# Altium project FPGA_ENTRY.PrjPcb
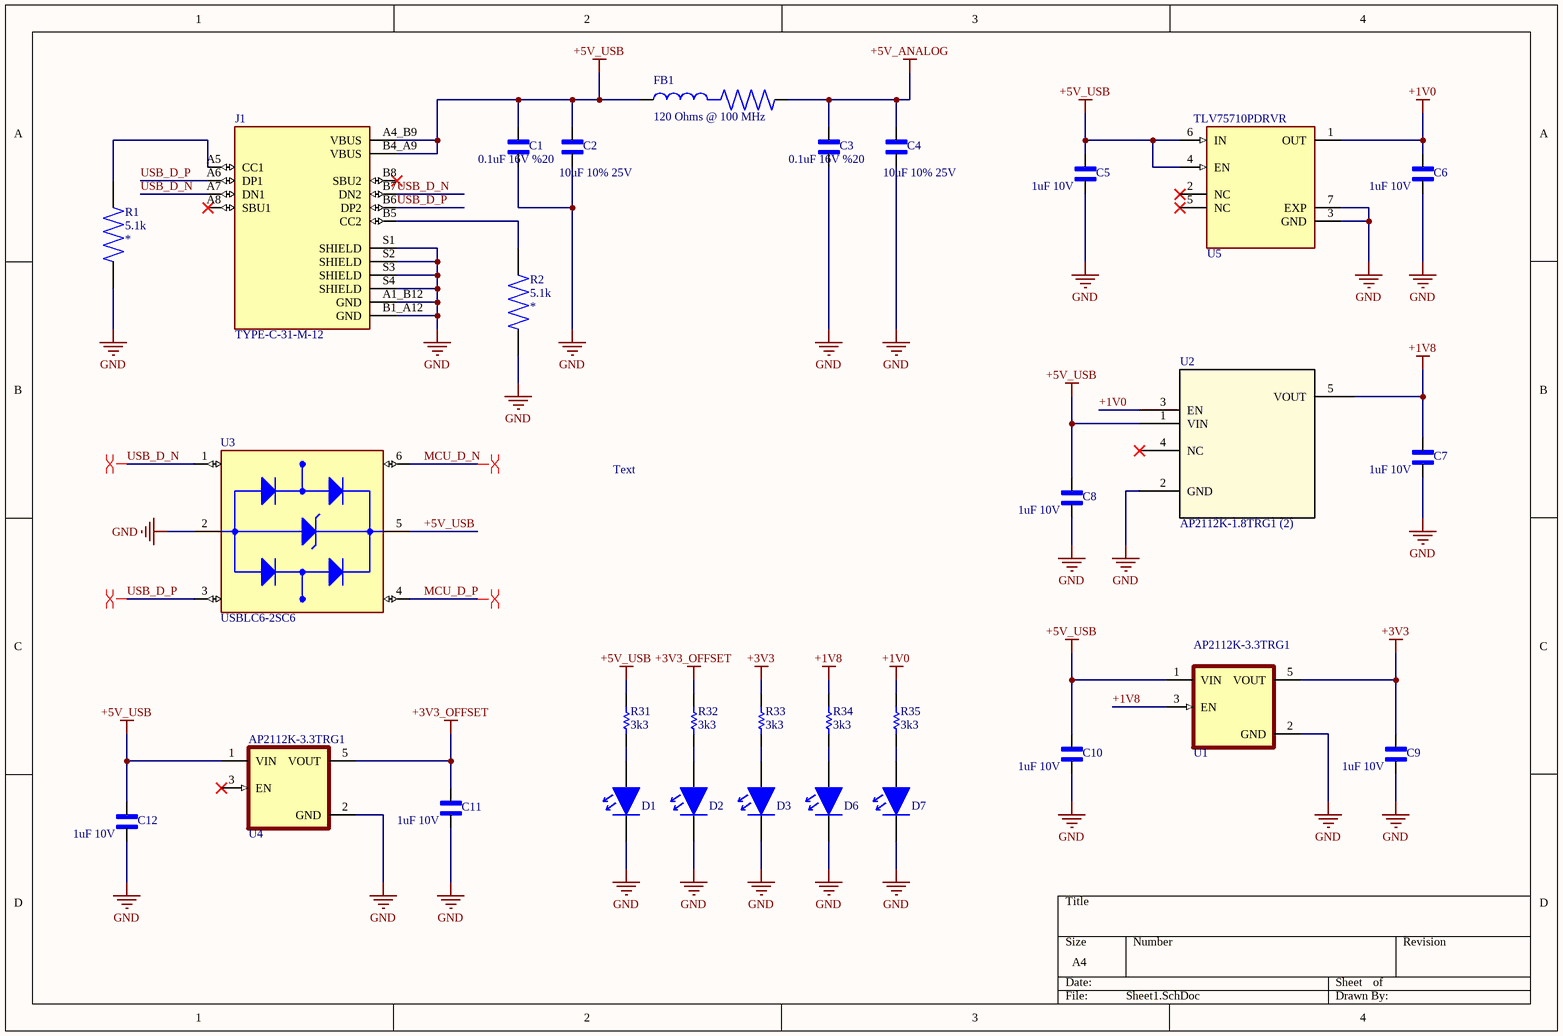
[diagram p0: Sheet1.SchDoc]
6 sheets, 134 parts. Net scope: global (net labels, ports and power ports of the same name join across sheets).
Board file: PCB1.PcbDoc
Sheets:
  Sheet1.SchDoc
  Sheet2.SchDoc
  Sheet3.SchDoc
  Sheet4.SchDoc
  Sheet5.SchDoc
  Sheet6.SchDoc

## Sheet Sheet1.SchDoc
size A4; SheetNumber: 1; SheetTotal: 6

### Parts
C1  Parameter 1: 0.1uF 16V %20  [0402]  (hidden comment: 0402YC104MAT2A)
C2  Parameter 1: 10uF 10% 25V  [0603]  (hidden comment: GRM21BZ71E106KE15L)
C3  Parameter 1: 0.1uF 16V %20  [0402]  (hidden comment: 0402YC104MAT2A)
C4  Parameter 1: 10uF 10% 25V  [0603]  (hidden comment: GRM21BZ71E106KE15L)
C5  Parameter 1: 1uF 10V  [0603]  (hidden comment: CAP_CER_0603)
C6  Parameter 1: 1uF 10V  [0603]  (hidden comment: CAP_CER_0603)
C7  Parameter 1: 1uF 10V  [0603]  (hidden comment: CAP_CER_0603)
C8  Parameter 1: 1uF 10V  [0603]  (hidden comment: CAP_CER_0603)
C9  Parameter 1: 1uF 10V  [0603]  (hidden comment: CAP_CER_0603)
C10  Parameter 1: 1uF 10V  [0603]  (hidden comment: CAP_CER_0603)
C11  Parameter 1: 1uF 10V  [0603]  (hidden comment: CAP_CER_0603)
C12  Parameter 1: 1uF 10V  [0603]  (hidden comment: CAP_CER_0603)
D1  LTST-C171GKT  [LED_GREEN_0805]  (value not drawn)
D2  LTST-C171GKT  [LED_GREEN_0805]  (value not drawn)
D3  LTST-C171GKT  [LED_GREEN_0805]  (value not drawn)
D6  LTST-C171GKT  [LED_GREEN_0805]  (value not drawn)
D7  LTST-C171GKT  [LED_GREEN_0805]  (value not drawn)
FB1  Parameter 1: 120 Ohms @ 100 MHz  [0603_FB]  (hidden comment: BLM18PG121SN1D)
J1  TYPE-C-31-M-12  [HRO_TYPE-C-31-M-12]
R1  5.1k  [0603]
R2  5.1k  [0603]
R31  3k3  [RESC1005X40X20NL05T10]
R32  3k3  [RESC1005X40X20NL05T10]
R33  3k3  [RESC1005X40X20NL05T10]
R34  3k3  [RESC1005X40X20NL05T10]
R35  3k3  [RESC1005X40X20NL05T10]
U1  AP2112K-3.3TRG1  [SOT-25]
U2  AP2112K-1.8TRG1 (2)  [AP2112K-1.8TRG1_DIO]
U3  USBLC6-2SC6  [SOT95P280X145-6N]
U4  AP2112K-3.3TRG1  [SOT-25]
U5  TLV75710PDRVR  [WSON-6]

### Nets
+1V0: C6.2 R35.2 U2.3(EN) U5.1(OUT)
+1V8: C7.2 R34.2 U1.3(EN) U2.5(VOUT)
+3V3: C9.2 R33.2 U1.5(VOUT)
+3V3_OFFSET: C11.2 R32.2 U4.5(VOUT)
+5V_ANALOG: C3.2 C4.2 FB1.2
+5V_USB: C1.2 C2.2 C5.2 C8.2 C10.2 C12.2 FB1.1 J1.A4_B9(VBUS) J1.B4_A9(VBUS) R31.2 U1.1(VIN) U2.1(VIN) U3.5(VBUS) U4.1(VIN) U5.4(EN) U5.6(IN)
GND: C1.1 C2.1 C3.1 C4.1 C5.1 C6.1 C7.1 C8.1 C9.1 C10.1 C11.1 C12.1 D1.1 D2.1 D3.1 D6.1 D7.1 J1.A1_B12(GND) J1.B1_A12(GND) J1.S1(SHIELD) J1.S2(SHIELD) J1.S3(SHIELD) J1.S4(SHIELD) R1.1 R2.1 U1.2(GND) U2.2(GND) U3.2(GND) U4.2(GND) U5.3(GND) U5.7(EXP)
MCU_D_N: U3.6(I/O1_OUT)
MCU_D_P: U3.4(I/O2_OUT)
USB_D_N: J1.A7(DN1) J1.B7(DN2) U3.1(I/O1_IN)
USB_D_P: J1.A6(DP1) J1.B6(DP2) U3.3(I/O2_IN)
NetD1_2: D1.2 R31.1
NetD2_2: D2.2 R32.1
NetD3_2: D3.2 R33.1
NetD6_2: D6.2 R34.1
NetD7_2: D7.2 R35.1
NetJ1_A5: J1.A5(CC1) R1.2
NetJ1_B5: J1.B5(CC2) R2.2

Not connected (* = marked no-connect by the designer): J1 A8(SBU1)* B8(SBU2)*; U2 4(NC)*; U4 3(EN)*; U5 2(NC)* 5(NC)*

### Layout directives
differential pair: MCU_D_N, MCU_D_P, USB_D_N, USB_D_P

### Notes on the sheet
- Text

### Library data of the parts
C1 C3 = CAP_CER_0402: 0.1 µF ±20% 16V Ceramic Capacitor X7R 0402 (1005 Metric)
C2 C4 = GRM21BZ71E106KE15L: SMD capacitor X7R(MURATA) with capacitance 10uF Tol.10%. Rated voltage 25Vdc 125C
C5-C12 = CAP_CER_0603: CAP CER 1UF 10V X7R 0603 / AC0603KRX7R6BB105
D1-D3 D6 D7 = LED GREEN 0805: Green 0805 130 º Min 5 mcd Typical 12 mcd Water Clear Lens SMT LED; Manufacturer: Vishay Lite-On; Designed by: BERK; Lens Color: Colorless; Viewing Angle: 130°; Lens Style: Diffused,Colorless,Rectangular,Clear; Luminous Intensity: 12mcd; Forward Current: 30mA; Forward Voltage: 2.1V; Power Rating: 100mW; Dominant Wavelength: 569nm; Test Current: 10mA; Number of Elements: 1; Wavelength: 585nm; Reverse Voltage: 5V; Supplier 1: Digi-Key; Manufacturer Part Number: LTST-C171GKT; RoHS: Yes; Category: LEDs; Stock 1: 159023; Pricing 1: 1=0,26000, 10=0,14100, 100=0,06560, 500=0,06060, 1000=0,04747 (USD); Mount: Surface Mount; Case/Package: 0805; Number of Pins: 2; Color: Green; Case Code (Metric): 2012; Case Code (Imperial): 0805; Min Operating Temperature: -55°C; Max Operating Temperature: 85°C; Package Quantity: 1; Packaging: Tape and Reel; Illumination Color: Green; Lens Transparency: Clear; Power Dissipation: 100mW; Number of LEDs: 1; Series: CHIPLED 0805; Length: 2mm; Width: 1.25mm; Height: 0.8mm; Depth: 1.25mm; Radiation Hardening: No; Lead Free: Lead Free; RoHS Compliant: Yes; ComponentLink1URL: https://datasheet.ciiva.com/2110/ltst-c171gkt-2110000.pdf?src-supplier=Digi-Key; ComponentLink1Description: https://datasheet.ciiva.com/2110/ltst-c171gkt-2110000.pdf?src-supplier=Digi-Key; ComponentLink2URL: https://datasheet.ciiva.com/11773/0900766b80dc0296-11773991.pdf?src-supplier=RSComponents; ComponentLink2Description: https://datasheet.ciiva.com/11773/0900766b80dc0296-11773991.pdf?src-supplier=RSComponents; ComponentLink3URL: https://datasheet.ciiva.com/12400/lite-on-ltst-c171gkt-190133-12400647.pdf?src-supplier=Mouser; ComponentLink3Description: https://datasheet.ciiva.com/12400/lite-on-ltst-c171gkt-190133-12400647.pdf?src-supplier=Mouser; ComponentLink4URL: https://datasheet.ciiva.com/2110/ltst-c171gkt-2110001.pdf?src-supplier=Digi-Key; ComponentLink4Description: https://datasheet.ciiva.com/2110/ltst-c171gkt-2110001.pdf?src-supplier=Digi-Key; ComponentLink5URL: https://datasheet.ciiva.com/2110/ltst-c171gkt-2110002.pdf?src-supplier=Digi-Key; ComponentLink5Description: https://datasheet.ciiva.com/2110/ltst-c171gkt-2110002.pdf?src-supplier=Digi-Key; ComponentLink6URL: https://datasheet.ciiva.com/16396/ltst-c171gkt-16396549.pdf?src-supplier=Future+Electronics; ComponentLink6Description: https://datasheet.ciiva.com/16396/ltst-c171gkt-16396549.pdf?src-supplier=Future+Electronics; Supplier Part Number 1: 160-1423-1-ND
FB1 = BLM18PG121SN1D: 120 Ohms @ 100 MHz 1 Power Line Ferrite Bead 0603 (1608 Metric) 2A 50mOhm
J1 = TYPE-C-31-M-12: USB Connectors 24 Receptacle 1 8.94*7.3mm RoHS; MF: HRO Electronics Co., Ltd.; SnapEDA_Link: https://www.snapeda.com/parts/TYPE-C-31-M-12/HRO+Electronics+Co.%252C+Ltd./view-part/?ref=snap; Package: Package; Value: *; MP: TYPE-C-31-M-12; Check_prices: https://www.snapeda.com/parts/TYPE-C-31-M-12/HRO+Electronics+Co.%252C+Ltd./view-part/?ref=eda
R1 R2 = RES_0603: Parameter 1: *
R31-R35 = CMP-2002-01682-1: Manufacturer: Vishay BCcomponents; Part Number: TNPW040210K0DEED
U1 U4 = AP2112K-3.3TRG1: Linear Voltage Regulator IC Positive Fixed 1 Output 600mA SOT-25
U2 = AP2112K-1.8TRG1 (2): AP2112 Series 1.8 V 600 mA Fixed Output SMT Voltage Regulator - SOT-23-5; Manufacturer: Diodes Inc.; Accuracy: 1.5%; Dropout Voltage: 500mV; Max Supply Voltage: 6V; Max Junction Temperature (Tj): 85°C; Max Output current: 600mA; Min Input Voltage: 2.5V; Number of Channels: 1; Output Voltage: 1.8V; Polarity: Positive; Quiescent Current: 80µA; Supplier: Arrow Electronics; Supplier Part Number: AP2112K-1.8TRG1; Manufacturer Part Number: AP2112K-1.8TRG1; RoHS: Compliant; Category: LDO Voltage Regulators; Stock: 5067; Pricing: 1=0,0897, 10=0,0624, 25=0,0577 (USD); Case/Package: LSSOP; China RoHS: Compliant; Export Control Classification Number (ECCN) Code: EAR99; Height: 1.3mm; Height - Seated (Max): 1.45mm; Harmonized Tariff Schedule (HTS) Code: 8542.39.00.60; Length: 2.92mm; Lifecycle Status: Production; Max Operating Temperature: 85°C; Min Operating Temperature: -40°C; Mounting Technology: Surface Mount; Number of Circuits: 1; Number of Outputs: 1; Pins: 5; Number of Regulators: 1; Number of Terminals: 5; Output Current: 600mA; Output Type: Fixed; Packaging: Tape & Reel (TR); REACH SVHC: Yes; Schedule B: 8542390000, 8542390000|8542390000, 8542390000|8542390000|8542390000, 8542390000|8542390000|8542390000|8542390000; Terminal Pitch: 950µm; Voltage Tolerance: 1.5%; Width: 1.6mm; ComponentLink1URL: https://datasheet.octopart.com:443/AP2112K-1.8TRG1-Diodes-Inc.-datasheet-101745658.pdf?src-supplier=IHS; ComponentLink1Description: https://datasheet.octopart.com:443/AP2112K-1.8TRG1-Diodes-Inc.-datasheet-101745658.pdf?src-supplier=IHS; ComponentLink2URL: https://datasheet.octopart.com:443/AP2112K-1.8TRG1-Diodes-Inc.-datasheet-182385097.pdf?src-supplier=IHS; ComponentLink2Description: https://datasheet.octopart.com:443/AP2112K-1.8TRG1-Diodes-Inc.-datasheet-182385097.pdf?src-supplier=IHS; ComponentLink3URL: https://datasheet.octopart.com:443/AP2112K-1.8TRG1-Diodes-Inc.-datasheet-37177583.pdf?src-supplier=SHENGYU+ELECTRONICS; ComponentLink3Description: https://datasheet.octopart.com:443/AP2112K-1.8TRG1-Diodes-Inc.-datasheet-37177583.pdf?src-supplier=SHENGYU+ELECTRONICS
U3 = USBLC6-2SC6: 17V Clamp 5A (8/20Âµs) Ipp Tvs Diode Surface Mount SOT-23-6; MF: STMicroelectronics; Value: *; SnapEDA_Link: https://www.snapeda.com/parts/USBLC6-2SC6/STMicroelectronics/view-part/?ref=snap; Check_prices: https://www.snapeda.com/parts/USBLC6-2SC6/STMicroelectronics/view-part/?ref=eda; Purchase-URL: https://pricing.snapeda.com/search/part/USBLC6-2SC6/?ref=eda; Price: None; Availability: In Stock; Package: SOT-23-6 STMicroelectronics; MP: USBLC6-2SC6
U5 = TLV75710PDRVR: 1-A, low-IQ high-accuracy low-dropout (LDO) voltage regulator with enable

## Sheet Sheet2.SchDoc
size A3; SheetNumber: 2; SheetTotal: 6
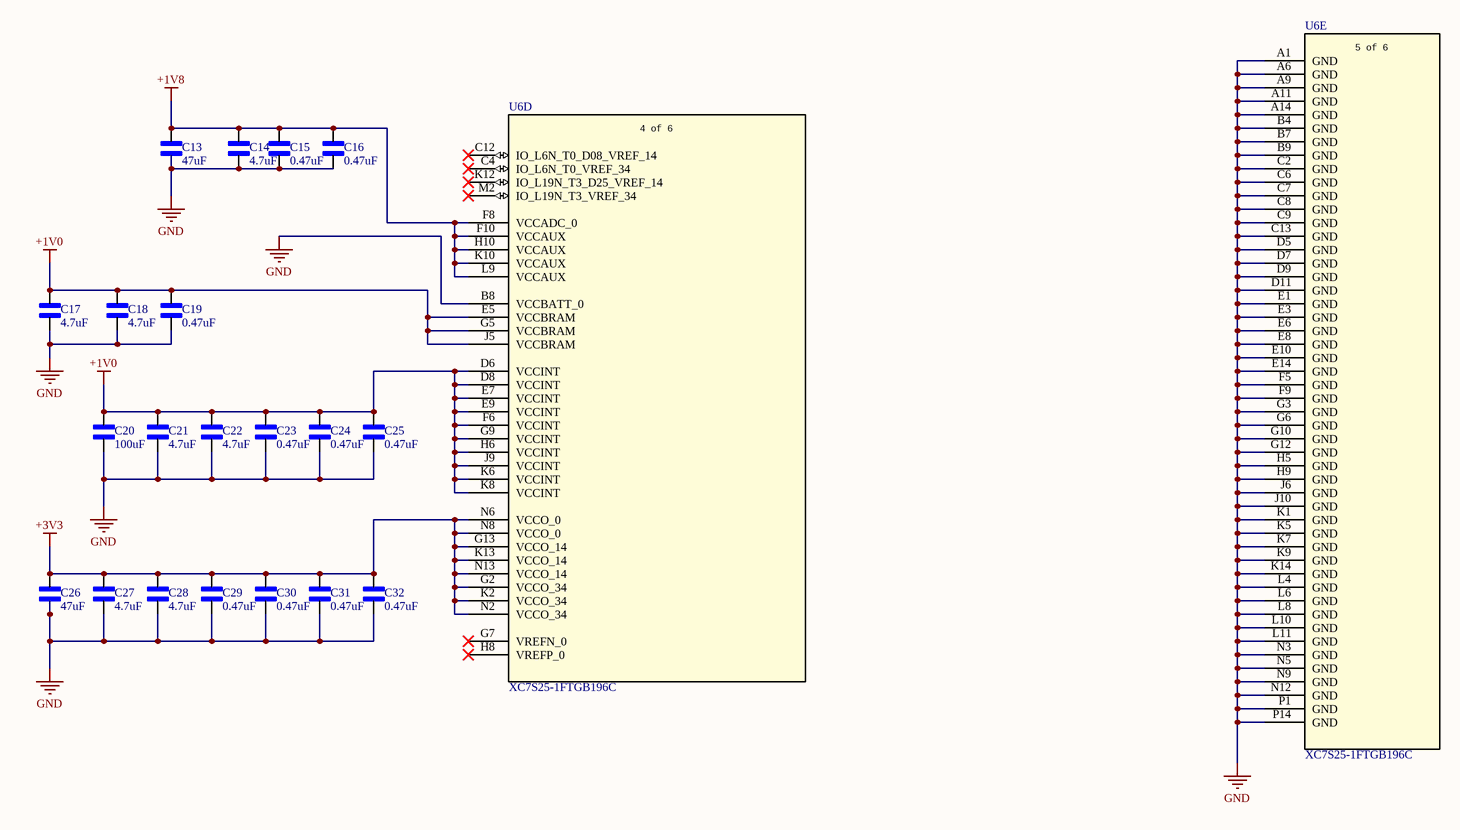
[diagram p1: Sheet2.SchDoc]

### Parts
C13  47uF  [GRM32ER70J476ME20L]
C14  4.7uF  [GRM21BR71A475KA73K]
C15  0.47uF  [GRM188R70J474KA01D]
C16  0.47uF  [GRM188R70J474KA01D]
C17  4.7uF  [GRM21BR71A475KA73K]
C18  4.7uF  [GRM21BR71A475KA73K]
C19  0.47uF  [GRM188R70J474KA01D]
C20  100uF  [GRM32ER60J107ME20L]
C21  4.7uF  [GRM21BR71A475KA73K]
C22  4.7uF  [GRM21BR71A475KA73K]
C23  0.47uF  [GRM188R70J474KA01D]
C24  0.47uF  [GRM188R70J474KA01D]
C25  0.47uF  [GRM188R70J474KA01D]
C26  47uF  [GRM32ER70J476ME20L]
C27  4.7uF  [GRM21BR71A475KA73K]
C28  4.7uF  [GRM21BR71A475KA73K]
C29  0.47uF  [GRM188R70J474KA01D]
C30  0.47uF  [GRM188R70J474KA01D]
C31  0.47uF  [GRM188R70J474KA01D]
C32  0.47uF  [GRM188R70J474KA01D]
U6  XC7S25-1FTGB196C  [FTGB196SPARTAN-7_AMD]  (parts D,E of 6)

### Nets
+1V0: C17.2 C18.2 C19.2 C20.2 C21.2 C22.2 C23.2 C24.2 C25.2 U6.D6(VCCINT) U6.D8(VCCINT) U6.E5(VCCBRAM) U6.E7(VCCINT) U6.E9(VCCINT) U6.F6(VCCINT) U6.G5(VCCBRAM) U6.G9(VCCINT) U6.H6(VCCINT) U6.J5(VCCBRAM) U6.J9(VCCINT) U6.K6(VCCINT) U6.K8(VCCINT)
+1V8: C13.2 C14.2 C15.2 C16.2 U6.F8(VCCADC_0) U6.F10(VCCAUX) U6.H10(VCCAUX) U6.K10(VCCAUX) U6.L9(VCCAUX)
+3V3: C26.2 C27.2 C28.2 C29.2 C30.2 C31.2 C32.2 U6.G2(VCCO_34) U6.G13(VCCO_14) U6.K2(VCCO_34) U6.K13(VCCO_14) U6.N2(VCCO_34) U6.N6(VCCO_0) U6.N8(VCCO_0) U6.N13(VCCO_14)
GND: C13.1 C14.1 C15.1 C16.1 C17.1 C18.1 C19.1 C20.1 C21.1 C22.1 C23.1 C24.1 C25.1 C26.1 C27.1 C28.1 C29.1 C30.1 C31.1 C32.1 U6.A1(GND) U6.A6(GND) U6.A9(GND) U6.A11(GND) U6.A14(GND) U6.B4(GND) U6.B7(GND) U6.B8(VCCBATT_0) U6.B9(GND) U6.C2(GND) U6.C6(GND) U6.C7(GND) U6.C8(GND) U6.C9(GND) U6.C13(GND) U6.D5(GND) U6.D7(GND) U6.D9(GND) U6.D11(GND) U6.E1(GND) U6.E3(GND) U6.E6(GND) U6.E8(GND) U6.E10(GND) U6.E14(GND) U6.F5(GND) U6.F9(GND) U6.G3(GND) U6.G6(GND) U6.G10(GND) U6.G12(GND) U6.H5(GND) U6.H9(GND) U6.J6(GND) U6.J10(GND) U6.K1(GND) U6.K5(GND) U6.K7(GND) U6.K9(GND) U6.K14(GND) U6.L4(GND) U6.L6(GND) U6.L8(GND) U6.L10(GND) U6.L11(GND) U6.N3(GND) U6.N5(GND) U6.N9(GND) U6.N12(GND) U6.P1(GND) U6.P14(GND)

Not connected (* = marked no-connect by the designer): U6 C4(IO_L6N_T0_VREF_34)* C12(IO_L6N_T0_D08_VREF_14)* G7(VREFN_0)* H8(VREFP_0)* K12(IO_L19N_T3_D25_VREF_14)* M2(IO_L19N_T3_VREF_34)*

### Notes on the sheet
- (in symbol XC7S25-1FTGB196C_1, part D) 4 of 6
- (in symbol XC7S25-1FTGB196C_1, part E) 5 of 6

### Library data of the parts
C13 C26 = GRM32ER70J476ME20L_1
C14 C17 C18 C21 C22 C27 C28 = GRM21BR71A475KA73K
C15 C16 C19 C23-C25 C29-C32 = GRM188R70J474KA01D
C20 = GRM32ER60J107ME20L
U6 = XC7S25-1FTGB196C_1: Description; Manufacturer_Name: AMD; Type: Embedded; Copyright: Copyright (C) 2025 Ultra Librarian. All rights reserved.; Manufacturer_Part_Number: XC7S25-1FTGB196C; RefDes: RefDes; Supplier: Arrow Electronics; Supplier Part Number: AD9226ARSZ

## Sheet Sheet3.SchDoc
size A4; SheetNumber: 3; SheetTotal: 6
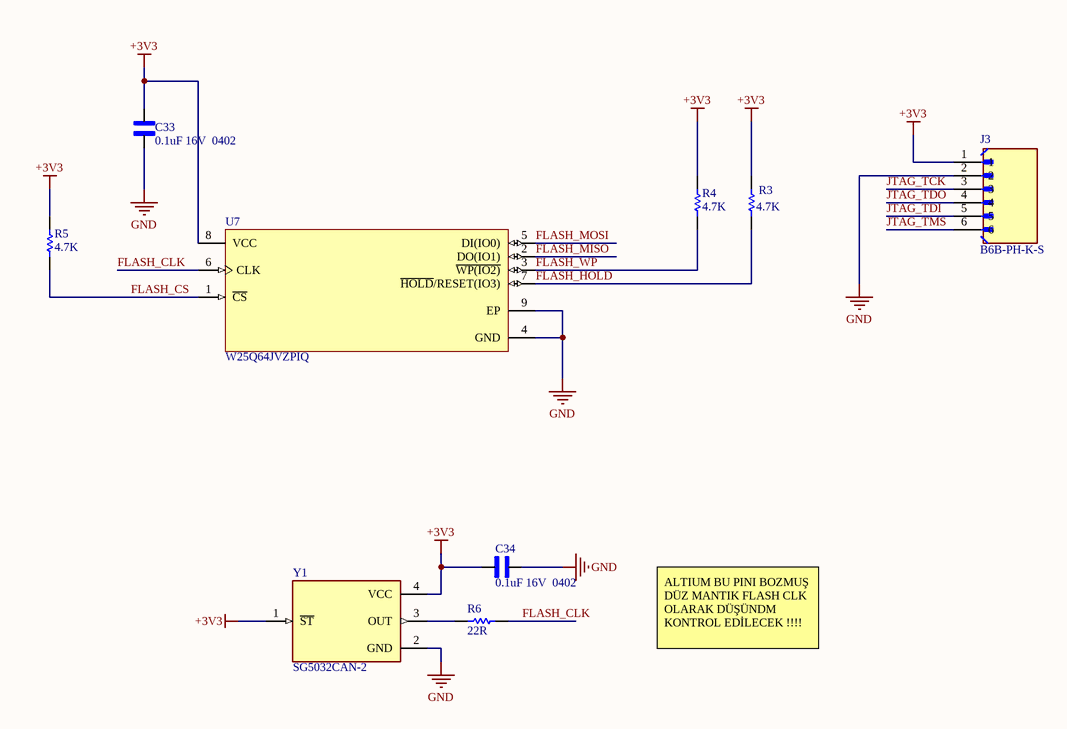
[diagram p2: Sheet3.SchDoc]

### Parts
C33  Parameter 1: 0.1uF 16V  0402  [0402]  (hidden comment: CC0402JRX7R7BB104)
C34  Parameter 1: 0.1uF 16V  0402  [0402]  (hidden comment: CC0402JRX7R7BB104)
J3  B6B-PH-K-S  [JST_B6B-PH-K-S]
R3  4.7K  [RESC1608X55X25LL10T15]
R4  4.7K  [RESC1608X55X25LL10T15]
R5  4.7K  [RESC1608X55X25LL10T15]
R6  22R  [RESC1608X55X25LL10T15]
U7  W25Q64JVZPIQ  [FP-ZP-MFG]
Y1  SG5032CAN-2  [SG5032CAN]

### Nets
+3V3: C33.2 C34.2 J3.1 R3.2 R4.2 R5.2 U7.8(VCC) Y1.1(~{ST}) Y1.4(VCC)
GND: C33.1 C34.1 J3.2 U7.4(GND) U7.9(EP) Y1.2(GND)
FLASH_CLK: R6.1 U7.6(CLK)
FLASH_CS: R5.1 U7.1(~{CS})
FLASH_HOLD: R3.1 U7.7(~{HOLD}/RESET(IO3))
FLASH_MISO: U7.2(DO(IO1))
FLASH_MOSI: U7.5(DI(IO0))
FLASH_WP: R4.1 U7.3(~{WP(IO2)})
JTAG_TCK: J3.3
JTAG_TDI: J3.5
JTAG_TDO: J3.4
JTAG_TMS: J3.6
NetR6_2: R6.2 Y1.3(OUT)

### Notes on the sheet
- ALTIUM BU PINI BOZMUŞ
  DÜZ MANTIK FLASH CLK OLARAK DÜŞÜNDM KONTROL EDİLECEK !!!!

### Library data of the parts
C33 C34 = CAP_CER_0402: CAP CER 0.1UF 16V X7R 0402
J3 = B6B-PH-K-S: Connector Header Through Hole 6 position 0.079 (2.00mm); MF: JST Sales; SnapEDA_Link: https://www.snapeda.com/parts/B6B-PH-K-S/JST+Sales+America+Inc./view-part/?ref=snap; Package: None; Value: *; MP: B6B-PH-K-S; Check_prices: https://www.snapeda.com/parts/B6B-PH-K-S/JST+Sales+America+Inc./view-part/?ref=eda
R3-R6 = CMP-2000-06928-1: Chip Resistor, 147 KOhm, +/- 1%, 0.1 W, -55 to 155 degC, 0603 (1608 Metric), RoHS, Tape and Reel; Manufacturer: Yageo; Temperature Coefficient: ±100ppm/°C; Power (Watts): 0.1W,1/10W; PCN Other: RC/AC0603/0805/120622/Jan/2013; Kits: PHH6-KIT-ND-RESKIT100K-1M1/10W5750PCS; EDA / CAD Models: DownloadfromAcceleratedDesigns; Online Catalog: RC0603Series; HTML Datasheet: RCSeries,LSuffixDatasheet.html; Resistance (Ohms): 147k; Catalog Drawings: ThickFilmResistorSide; Other Names: 311-147KHRCT; Product Training Modules: ChipResistor; Series: RC; Height: 0.022"(0.55mm); Number of Terminations: 2; Family: ChipResistor-SurfaceMount; Manufacturer URL: http://www.yageo.com/; Tolerance: ±1%; Operating Temperature: -55°C~155°C; Datasheet Version: Rev. 7, 05/2017; Standard Package: 1; Category: Resistors; Packaging: CutTape(CT); Size / Dimension: 0.063"Lx0.031"W(1.60mmx0.80mm); Datasheet URL: http://www.yageo.com/documents/recent/PYu-RC_Group_51_RoHS_L_7.pdf; Package / Case: 0603(1608Metric); Package Reference: 0603; Supplier Device Package: 0603; Composition: ThickFilm; Features: MoistureResistant; Mounting Technology: SurfaceMount; Package Description: 2-Pin Surface Mount Device, Body 1.6 x 0.8 mm
U7 = CMP-00619-80966617-1: W25Q64JVZPIQ NOR Flash Serial (SPI, Dual SPI, Quad SPI) 3V/3.3V 64M-bit 8M x 8 6ns 8-Pin WSON EP T/R/Tray/Tube; Memory Size: 8MB; Max Supply Voltage: 3.6V; Min Supply Voltage: 2.7V; Frequency: 133MHz; NexarPartId: 80966617; Memory Type: FLASH; Height: 800µm; Max Operating Temperature: 85°C; Interface: SPI; Ambient Temperature Range High: 85°C; Min Operating Temperature: -40°C; Schedule B: 8542320070, 8542320070; RoHS: Non-Compliant; Access Time: 6ns
Y1 = SG5032CAN-2: SG5032CAN

## Sheet Sheet4.SchDoc
size A3; SheetNumber: 4; SheetTotal: 6
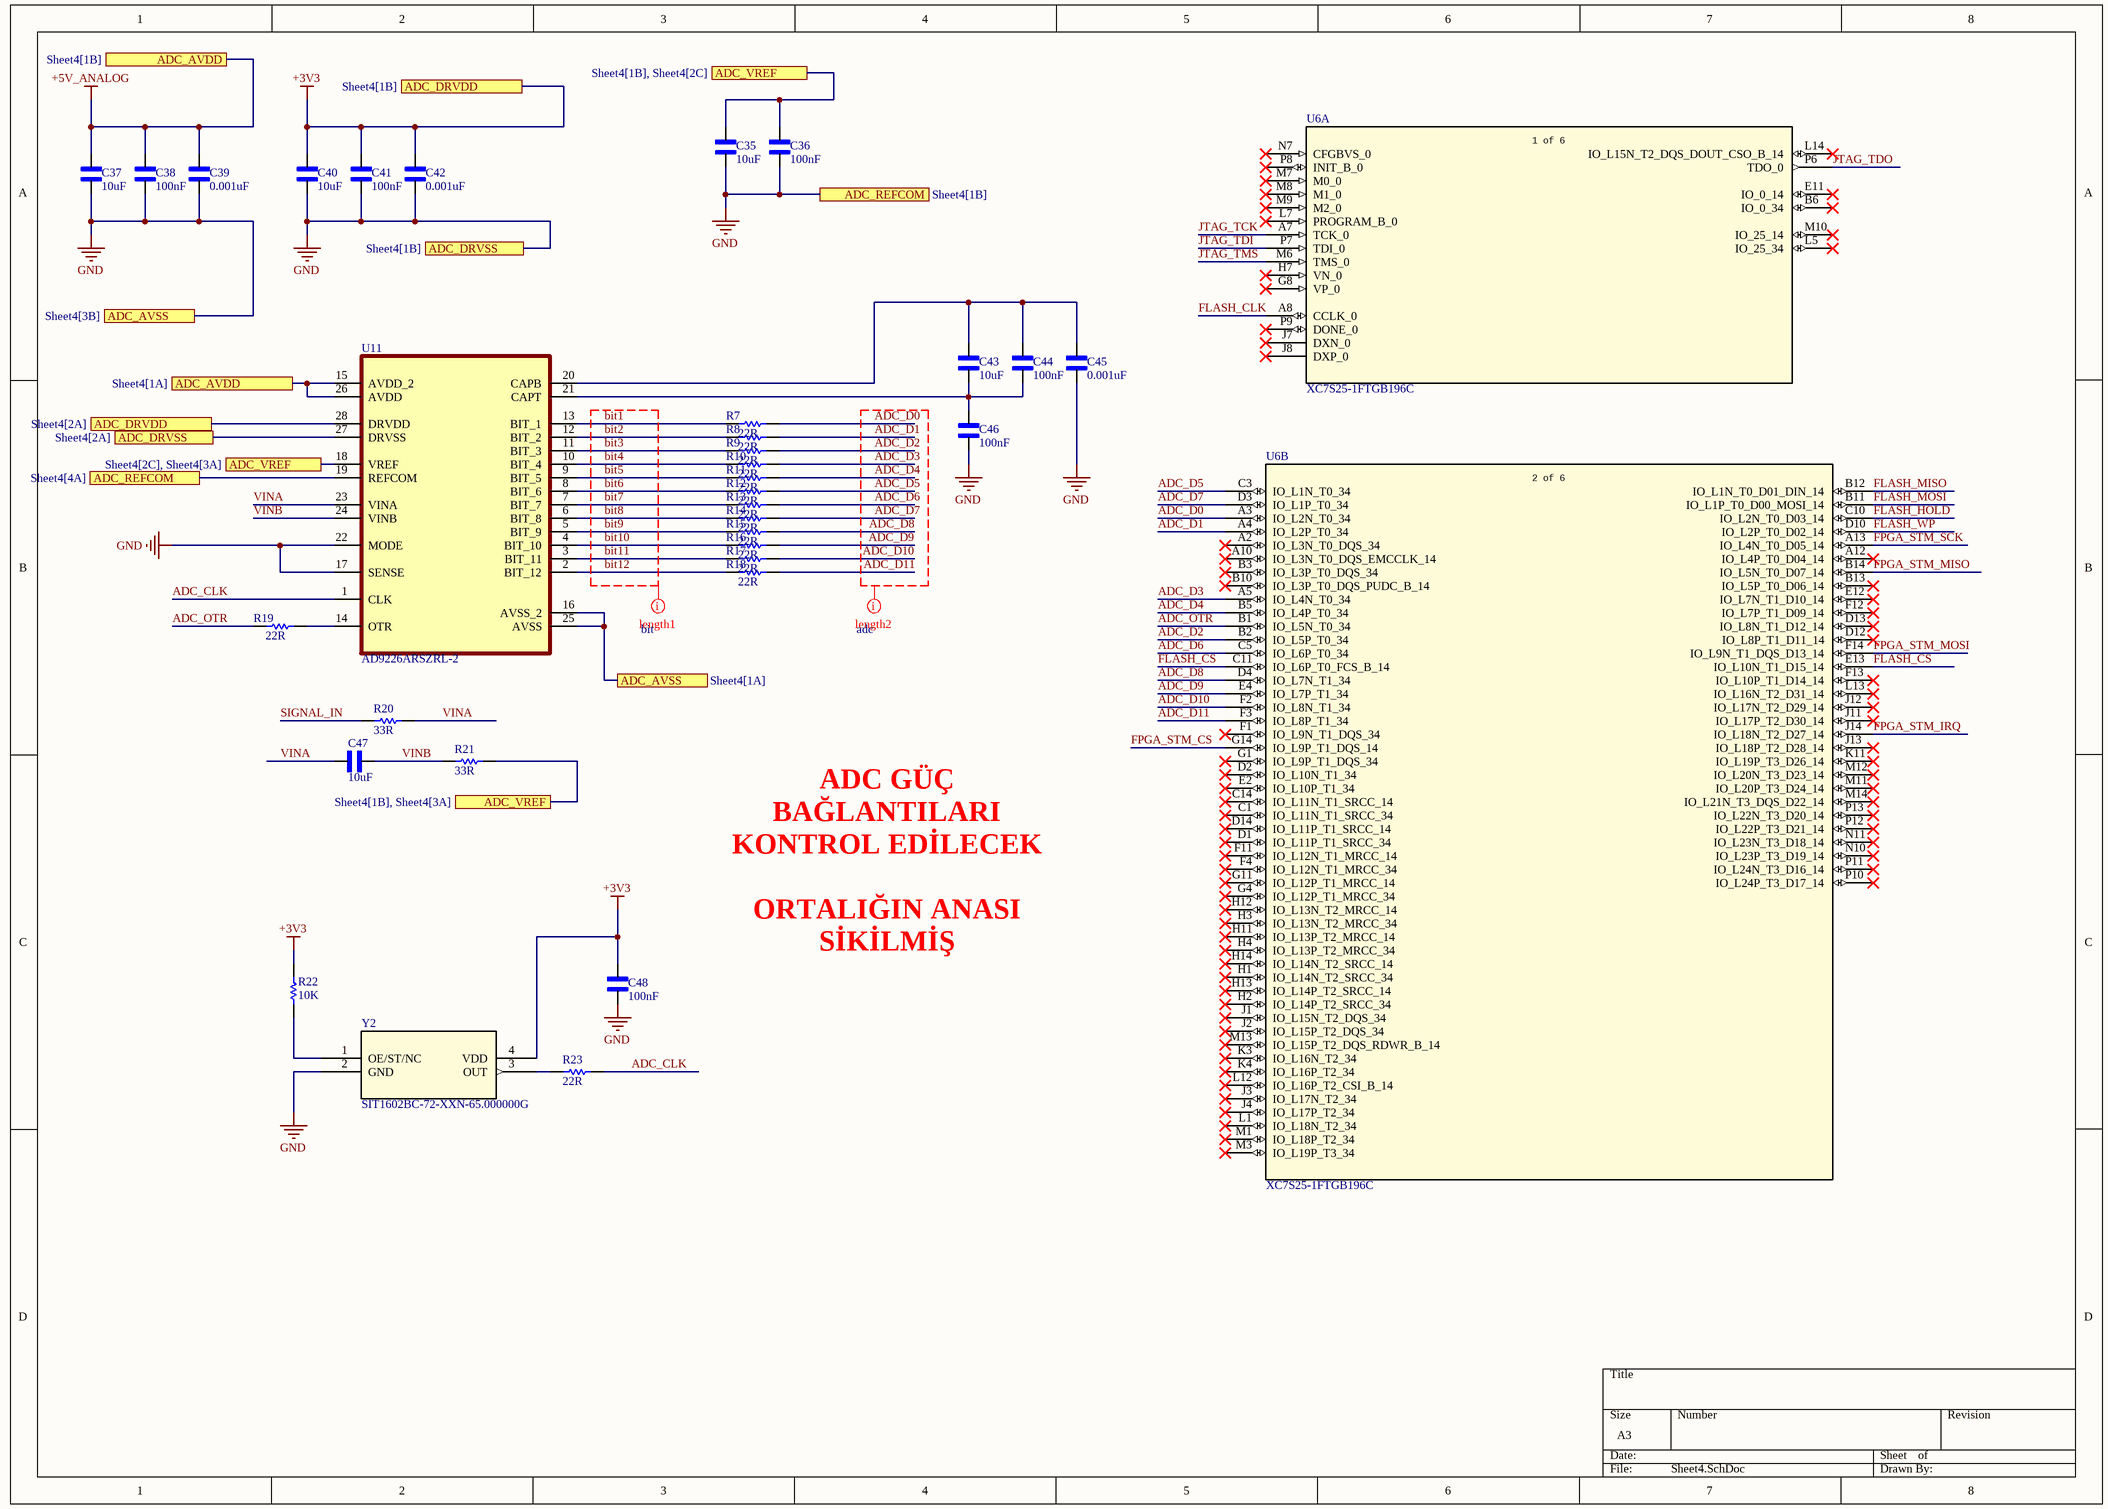
[diagram p3: Sheet4.SchDoc]

### Parts
C35  Parameter 1: 10uF  [0603]  (hidden comment: CAP_CER_0603)
C36  Parameter 1: 100nF  [0603]  (hidden comment: CAP_CER_0603)
C37  Parameter 1: 10uF  [0603]  (hidden comment: CAP_CER_0603)
C38  Parameter 1: 100nF  [0402]  (hidden comment: CC0402JRX7R7BB104)
C39  Parameter 1: 0.001uF  [0402]  (hidden comment: CC0402JRX7R7BB104)
C40  Parameter 1: 10uF  [0603]  (hidden comment: CAP_CER_0603)
C41  Parameter 1: 100nF  [0402]  (hidden comment: CC0402JRX7R7BB104)
C42  Parameter 1: 0.001uF  [0402]  (hidden comment: CC0402JRX7R7BB104)
C43  Parameter 1: 10uF  [0603]  (hidden comment: CAP_CER_0603)
C44  Parameter 1: 100nF  [0402]  (hidden comment: CC0402JRX7R7BB104)
C45  Parameter 1: 0.001uF  [0402]  (hidden comment: CC0402JRX7R7BB104)
C46  Parameter 1: 100nF  [0402]  (hidden comment: CC0402JRX7R7BB104)
C47  Parameter 1: 10uF  [0603]  (hidden comment: CAP_CER_0603)
C48  Parameter 1: 100nF  [0402]  (hidden comment: CC0402JRX7R7BB104)
R7  22R  [RESC1608X55X25LL10T15]
R8  22R  [RESC1608X55X25LL10T15]
R9  22R  [RESC1608X55X25LL10T15]
R10  22R  [RESC1608X55X25LL10T15]
R11  22R  [RESC1608X55X25LL10T15]
R12  22R  [RESC1608X55X25LL10T15]
R13  22R  [RESC1608X55X25LL10T15]
R14  22R  [RESC1608X55X25LL10T15]
R15  22R  [RESC1608X55X25LL10T15]
R16  22R  [RESC1608X55X25LL10T15]
R17  22R  [RESC1608X55X25LL10T15]
R18  22R  [RESC1608X55X25LL10T15]
R19  22R  [RESC1608X55X25LL10T15]
R20  33R  [RESC1608X55X25LL10T15]
R21  33R  [RESC1608X55X25LL10T15]
R22  10K  [RESC1608X55X25LL10T15]
R23  22R  [RESC1608X55X25LL10T15]
U6  XC7S25-1FTGB196C  [FTGB196SPARTAN-7_AMD]  (parts A,B of 6)
U11  AD9226ARSZRL-2  [SSOP-28]
Y2  SIT1602BC-72-XXN-65.000000G  [SON4_SIT1602-7_SIT]

### Ports
ADC_AVDD (see Sheet4[1A]), ADC_AVDD (see Sheet4[1B]), ADC_AVSS (see Sheet4[1A]), ADC_AVSS (see Sheet4[3B]), ADC_DRVDD (see Sheet4[1B]), ADC_DRVDD (see Sheet4[2A]), ADC_DRVSS (see Sheet4[1B]), ADC_DRVSS (see Sheet4[2A]), ADC_REFCOM (see Sheet4[1B]), ADC_REFCOM (see Sheet4[4A]), ADC_VREF (see Sheet4[1B], Sheet4[2C]), ADC_VREF (see Sheet4[1B], Sheet4[3A]), ADC_VREF (see Sheet4[2C], Sheet4[3A])

### Nets
+3V3: C40.2 C41.2 C42.2 C48.2 R22.1 U11.28(DRVDD) Y2.4(VDD) ; port ADC_DRVDD
+5V_ANALOG: C37.2 C38.2 C39.2 U11.15(AVDD_2) U11.26(AVDD) ; port ADC_AVDD
GND: C35.1 C36.1 C37.1 C38.1 C39.1 C40.1 C41.1 C42.1 C45.1 C46.1 C48.1 U11.16(AVSS_2) U11.17(SENSE) U11.19(REFCOM) U11.22(MODE) U11.25(AVSS) U11.27(DRVSS) Y2.2(GND) ; port ADC_REFCOM, port ADC_DRVSS, port ADC_AVSS
ADC_CLK: R23.1 U11.1(CLK)
ADC_D0: R7.1 U6.A3(IO_L2N_T0_34)
ADC_D1: R8.1 U6.A4(IO_L2P_T0_34)
ADC_D2: R9.1 U6.B2(IO_L5P_T0_34)
ADC_D3: R10.1 U6.A5(IO_L4N_T0_34)
ADC_D4: R11.1 U6.B5(IO_L4P_T0_34)
ADC_D5: R12.1 U6.C3(IO_L1N_T0_34)
ADC_D6: R13.1 U6.C5(IO_L6P_T0_34)
ADC_D7: R14.1 U6.D3(IO_L1P_T0_34)
ADC_D8: R15.1 U6.D4(IO_L7N_T1_34)
ADC_D9: R16.1 U6.E4(IO_L7P_T1_34)
ADC_D10: R17.1 U6.F2(IO_L8N_T1_34)
ADC_D11: R18.1 U6.F3(IO_L8P_T1_34)
ADC_OTR: R19.2 U6.B1(IO_L5N_T0_34)
bit1: R7.2 U11.13(BIT_1)
bit2: R8.2 U11.12(BIT_2)
bit3: R9.2 U11.11(BIT_3)
bit4: R10.2 U11.10(BIT_4)
bit5: R11.2 U11.9(BIT_5)
bit6: R12.2 U11.8(BIT_6)
bit7: R13.2 U11.7(BIT_7)
bit8: R14.2 U11.6(BIT_8)
bit9: R15.2 U11.5(BIT_9)
bit10: R16.2 U11.4(BIT_10)
bit11: R17.2 U11.3(BIT_11)
bit12: R18.2 U11.2(BIT_12)
FLASH_CLK: U6.A8(CCLK_0)
FLASH_CS: U6.C11(IO_L6P_T0_FCS_B_14) U6.E13(IO_L10N_T1_D15_14)
FLASH_HOLD: U6.C10(IO_L2N_T0_D03_14)
FLASH_MISO: U6.B12(IO_L1N_T0_D01_DIN_14)
FLASH_MOSI: U6.B11(IO_L1P_T0_D00_MOSI_14)
FLASH_WP: U6.D10(IO_L2P_T0_D02_14)
FPGA_STM_CS: U6.G14(IO_L9P_T1_DQS_14)
FPGA_STM_IRQ: U6.J14(IO_L18N_T2_D27_14)
FPGA_STM_MISO: U6.B14(IO_L5N_T0_D07_14)
FPGA_STM_MOSI: U6.F14(IO_L9N_T1_DQS_D13_14)
FPGA_STM_SCK: U6.A13(IO_L4N_T0_D05_14)
JTAG_TCK: U6.A7(TCK_0)
JTAG_TDI: U6.P7(TDI_0)
JTAG_TDO: U6.P6(TDO_0)
JTAG_TMS: U6.M6(TMS_0)
SIGNAL_IN: R20.2
VINA: C47.2 R20.1 U11.23(VINA)
VINB: C47.1 R21.2 U11.24(VINB)
NetC35_2: C35.2 C36.2 R21.1 U11.18(VREF) ; port ADC_VREF
NetC43_1: C43.1 C44.1 C46.2 U11.21(CAPT)
NetC43_2: C43.2 C44.2 C45.2 U11.20(CAPB)
NetR19_1: R19.1 U11.14(OTR)
NetR22_2: R22.2 Y2.1(OE/ST/NC)
NetR23_2: R23.2 Y2.3(OUT)

Not connected (* = marked no-connect by the designer): U6 A2(IO_L3N_T0_DQS_34)* A10(IO_L3N_T0_DQS_EMCCLK_14)* A12(IO_L4P_T0_D04_14)* B3(IO_L3P_T0_DQS_34)* B6(IO_0_34)* B10(IO_L3P_T0_DQS_PUDC_B_14)* B13(IO_L5P_T0_D06_14)* C1(IO_L11N_T1_SRCC_34)* C14(IO_L11N_T1_SRCC_14)* D1(IO_L11P_T1_SRCC_34)* D2(IO_L10N_T1_34)* D12(IO_L8P_T1_D11_14)* D13(IO_L8N_T1_D12_14)* D14(IO_L11P_T1_SRCC_14)* E2(IO_L10P_T1_34)* E11(IO_0_14)* E12(IO_L7N_T1_D10_14)* F1(IO_L9N_T1_DQS_34)* F4(IO_L12N_T1_MRCC_34)* F11(IO_L12N_T1_MRCC_14)* F12(IO_L7P_T1_D09_14)* F13(IO_L10P_T1_D14_14)* G1(IO_L9P_T1_DQS_34)* G4(IO_L12P_T1_MRCC_34)* G8(VP_0)* G11(IO_L12P_T1_MRCC_14)* H1(IO_L14N_T2_SRCC_34)* H2(IO_L14P_T2_SRCC_34)* H3(IO_L13N_T2_MRCC_34)* H4(IO_L13P_T2_MRCC_34)* H7(VN_0)* H11(IO_L13P_T2_MRCC_14)* H12(IO_L13N_T2_MRCC_14)* H13(IO_L14P_T2_SRCC_14)* H14(IO_L14N_T2_SRCC_14)* J1(IO_L15N_T2_DQS_34)* J2(IO_L15P_T2_DQS_34)* J3(IO_L17N_T2_34)* J4(IO_L17P_T2_34)* J7(DXN_0)* J8(DXP_0)* J11(IO_L17P_T2_D30_14)* J12(IO_L17N_T2_D29_14)* J13(IO_L18P_T2_D28_14)* K3(IO_L16N_T2_34)* K4(IO_L16P_T2_34)* K11(IO_L19P_T3_D26_14)* L1(IO_L18N_T2_34)* L5(IO_25_34)* L7(PROGRAM_B_0)* L12(IO_L16P_T2_CSI_B_14)* L13(IO_L16N_T2_D31_14)* L14(IO_L15N_T2_DQS_DOUT_CSO_B_14)* M1(IO_L18P_T2_34)* M3(IO_L19P_T3_34)* M7(M0_0)* M8(M1_0)* M9(M2_0)* M10(IO_25_14)* M11(IO_L20P_T3_D24_14)* M12(IO_L20N_T3_D23_14)* M13(IO_L15P_T2_DQS_RDWR_B_14)* M14(IO_L21N_T3_DQS_D22_14)* N7(CFGBVS_0)* N10(IO_L23P_T3_D19_14)* N11(IO_L23N_T3_D18_14)* P8(INIT_B_0)* P9(DONE_0)* P10(IO_L24P_T3_D17_14)* P11(IO_L24N_T3_D16_14)* P12(IO_L22P_T3_D21_14)* P13(IO_L22N_T3_D20_14)*

### Layout directives
net class bit: bit1, bit2, bit3, bit4, bit5, bit6, bit7, bit8, bit9, bit10, bit11, bit12
net class adc: ADC_D0, ADC_D1, ADC_D2, ADC_D3, ADC_D4, ADC_D5, ADC_D6, ADC_D7, ADC_D8, ADC_D9, ADC_D10, ADC_D11

### Notes on the sheet
- ADC GÜÇ BAĞLANTILARI KONTROL EDİLECEK
  ORTALIĞIN ANASI SİKİLMİŞ
- (in symbol XC7S25-1FTGB196C_1, part A) 1 of 6
- (in symbol XC7S25-1FTGB196C_1, part B) 2 of 6

### Library data of the parts
C38 C39 C41 C42 C44-C46 C48 = CAP_CER_0402: CAP CER 0.1UF 16V X7R 0402
R7-R23 = CMP-2000-06928-1: as R3 on sheet Sheet3; Product Training Modules: ChipResistor; Series: RC; Height: 0.022"(0.55mm); Number of Terminations: 2; Family: ChipResistor-SurfaceMount; Manufacturer URL: http://www.yageo.com/; Tolerance: ±1%; Operating Temperature: -55°C~155°C; Datasheet Version: Rev. 7, 05/2017; Standard Package: 1; Category: Resistors; Packaging: CutTape(CT); Size / Dimension: 0.063"Lx0.031"W(1.60mmx0.80mm); Datasheet URL: http://www.yageo.com/documents/recent/PYu-RC_Group_51_RoHS_L_7.pdf; Package / Case: 0603(1608Metric); Package Reference: 0603; Supplier Device Package: 0603; Composition: ThickFilm; Features: MoistureResistant; Mounting Technology: SurfaceMount; Package Description: 2-Pin Surface Mount Device, Body 1.6 x 0.8 mm
U6 = XC7S25-1FTGB196C_1: Description; Manufacturer_Name: AMD; Type: Embedded; Copyright: Copyright (C) 2025 Ultra Librarian. All rights reserved.; Manufacturer_Part_Number: XC7S25-1FTGB196C; RefDes: RefDes; Supplier: Arrow Electronics; Supplier Part Number: AD9226ARSZ
U11 = AD9226ARSZRL-2: 12-Bit, 65 MSPS Analog-to-Digital Converter
Y2 = SIT1602BC-72-XXN-65.000000G: Oscillator MEMS 65MHz ±25ppm (Stability) 15pF HCMOS/LVCMOS 55% 2.5V/3.3V 4-Pin QFN SMD T/R; Manufacturer: SiTime; Fall Time: 2ns; Max Supply Voltage: 3.63V; Min Supply Voltage: 2.25V; Output Type: LVCMOS; Supplier: Avnet; Supplier Part Number: SIT1602BC-72-XXN-65.000000G; Manufacturer Part Number: SIT1602BC-72-XXN-65.000000G; RoHS: Compliant; Category: Crystals; Pricing: 250=0,94997, 500=0,93011, 1000=0,91025, 2000=0,89039, 4000=0,87053 (USD); Country of Origin: Malaysia, Taiwan, Thailand; Frequency: 65MHz; Frequency Stability: 25ppm; Introduction Date: 2017-05-31; Lifecycle Status: Production; Load Capacitance: 15pF; Max Operating Temperature: 70°C; Min Operating Temperature: -20°C; Mounting Technology: Surface Mount; Number of Terminals: 4; REACH SVHC: Yes; Rise Time: 2ns; ComponentLink1URL: https://datasheet.octopart.com:443/SIT1602BC-72-XXN-65.000000G-SiTime-datasheet-168041894.pdf?src-supplier=IHS; ComponentLink1Description: https://datasheet.octopart.com:443/SIT1602BC-72-XXN-65.000000G-SiTime-datasheet-168041894.pdf?src-supplier=IHS; ComponentLink2URL: https://datasheet.octopart.com:443/SIT1602BC-72-XXN-65.000000G-SiTime-datasheet-180805158.pdf?src-supplier=IHS; ComponentLink2Description: https://datasheet.octopart.com:443/SIT1602BC-72-XXN-65.000000G-SiTime-datasheet-180805158.pdf?src-supplier=IHS

## Sheet Sheet5.SchDoc
size A3; SheetNumber: 5; SheetTotal: 6
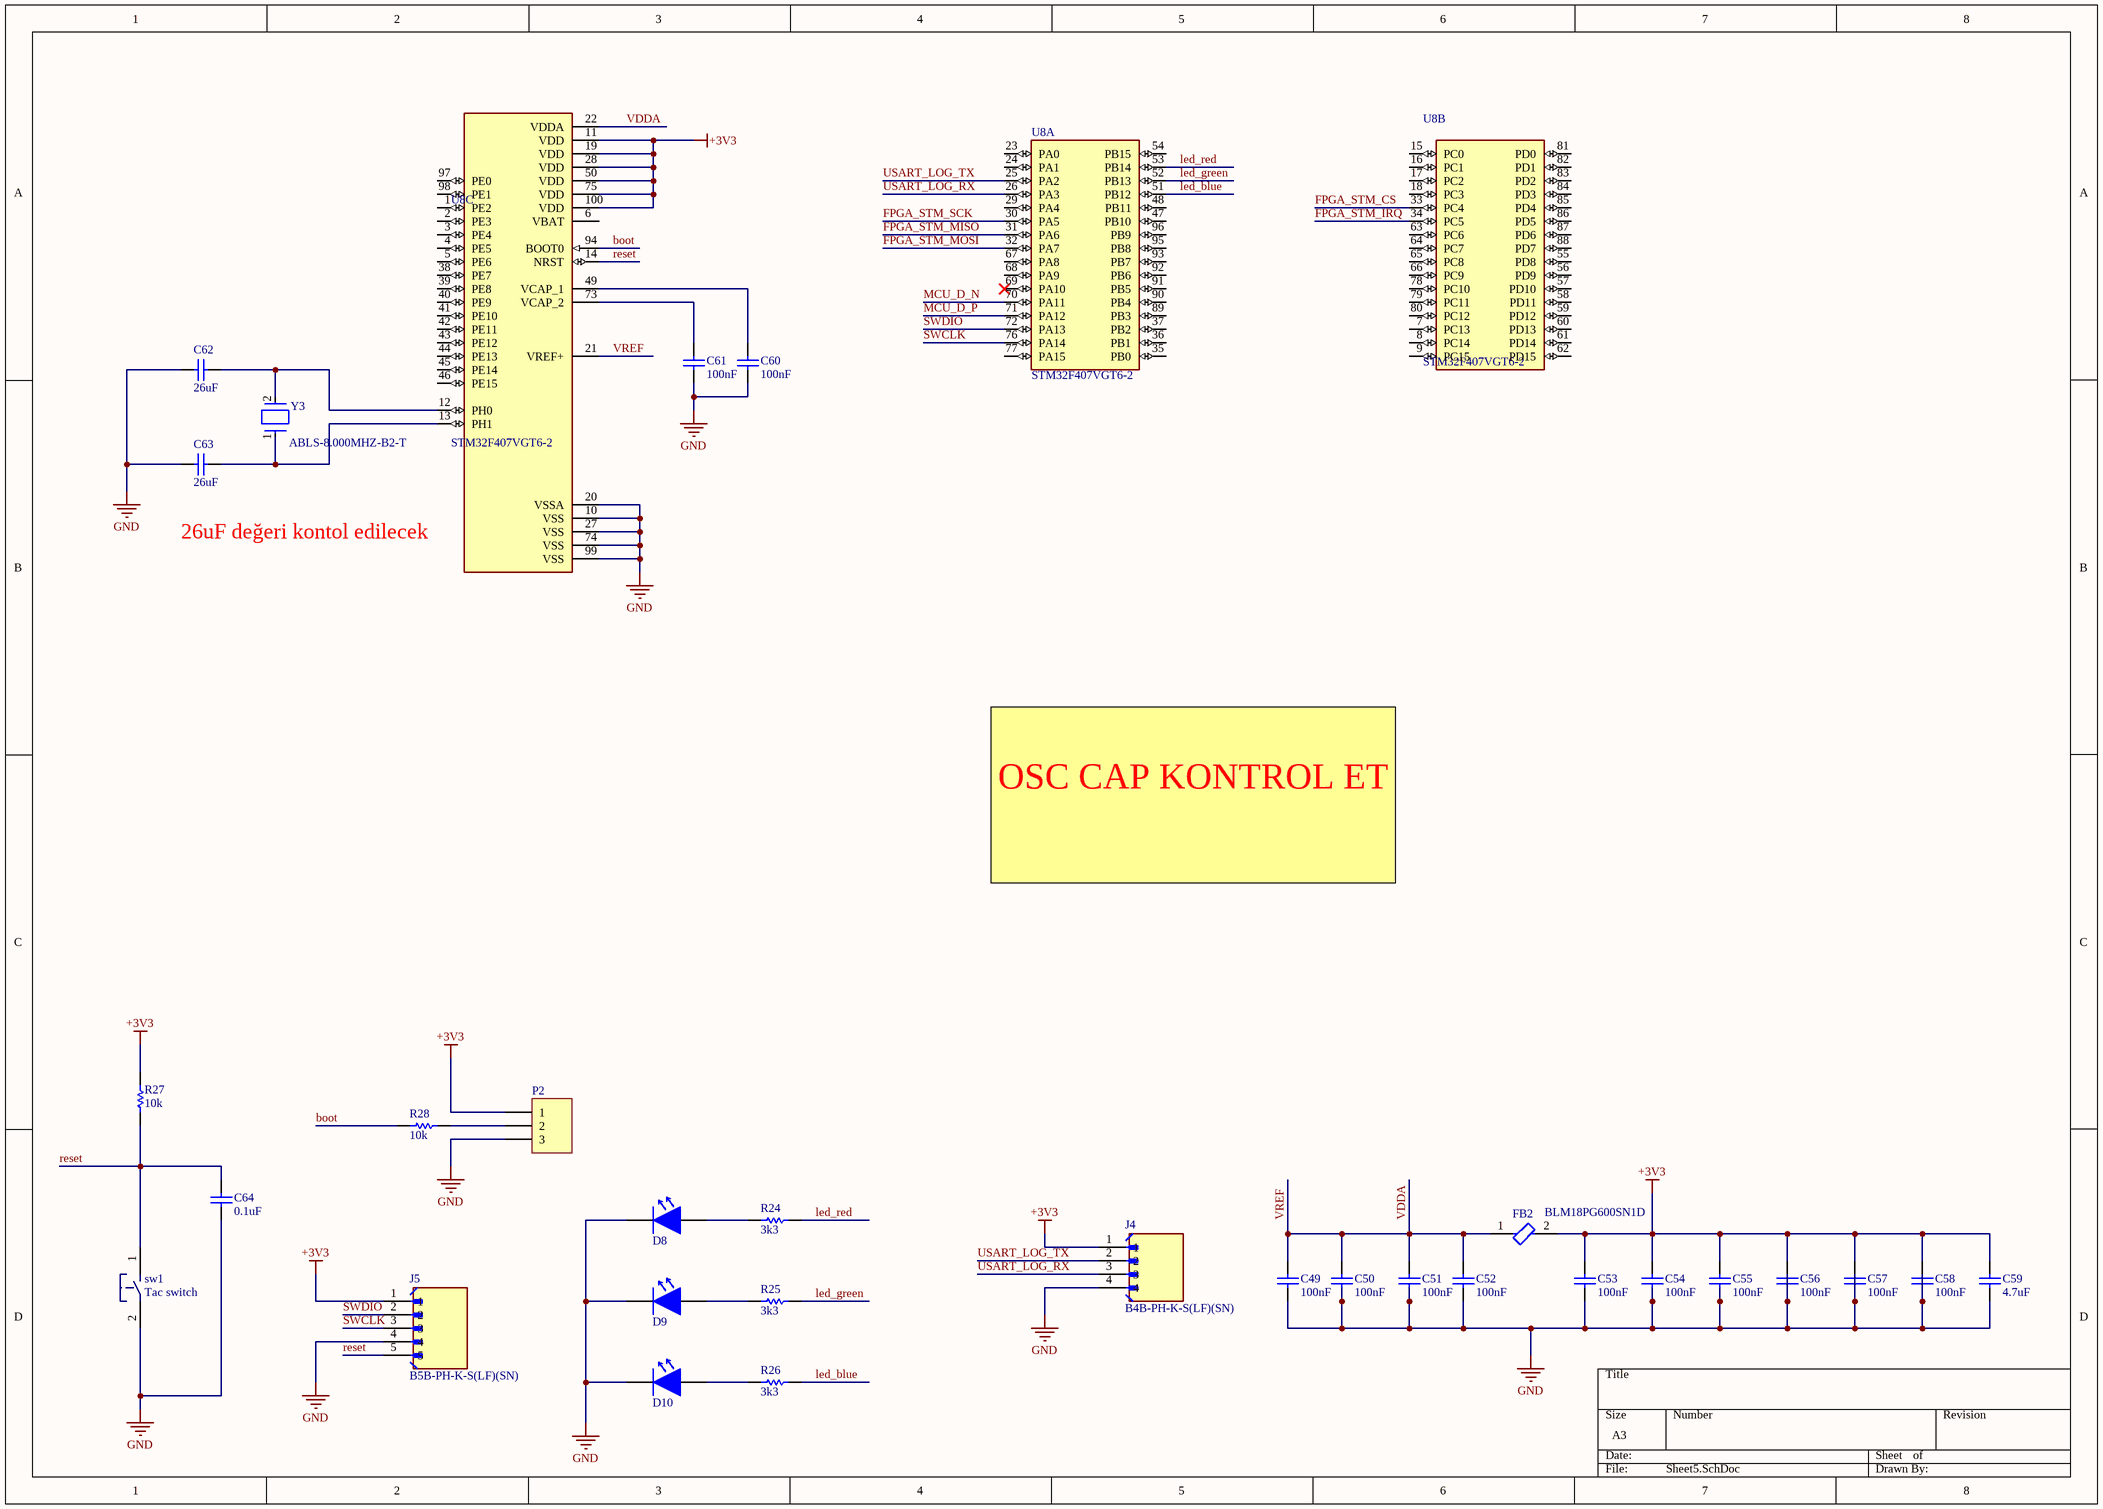
[diagram p4: Sheet5.SchDoc]

### Parts
C49  100nF  [CAPC0603(1608)100_L]
C50  100nF  [CAPC0603(1608)100_L]
C51  100nF  [CAPC0603(1608)100_L]
C52  100nF  [CAPC0603(1608)100_L]
C53  100nF  [CAPC0603(1608)100_L]
C54  100nF  [CAPC0603(1608)100_L]
C55  100nF  [CAPC0603(1608)100_L]
C56  100nF  [CAPC0603(1608)100_L]
C57  100nF  [CAPC0603(1608)100_L]
C58  100nF  [CAPC0603(1608)100_L]
C59  4.7uF  [CAPC0603(1608)100_L]
C60  100nF  [CAPC0603(1608)100_L]
C61  100nF  [CAPC0603(1608)100_L]
C62  26uF  [CAPC0603(1608)100_L]
C63  26uF  [CAPC0603(1608)100_L]
C64  0.1uF  [CAPC0603(1608)100_L]
D8  LH R974-LP-1  [LED_RED_0805]  (value not drawn)
D9  LH R974-LP-1  [LED_RED_0805]  (value not drawn)
D10  LH R974-LP-1  [LED_RED_0805]  (value not drawn)
FB2  BLM18PG600SN1D  [FP-BLM18-0_15-t0_8-IPC_B]
J4  B4B-PH-K-S(LF)(SN)  [JST_B4B-PH-K-S(LF)(SN)]
J5  B5B-PH-K-S(LF)(SN)  [JST_B5B-PH-K-S(LF)(SN)]
P2  Header 3  [My_1X03]  (value not drawn)
R24  3k3  [RESC1005X40X20NL05T10]
R25  3k3  [RESC1005X40X20NL05T10]
R26  3k3  [RESC1005X40X20NL05T10]
R27  10k  [RESC1005X40X20NL05T10]
R28  10k  [RESC1005X40X20NL05T10]
sw1  Tac switch  [MY_TACTILE-PTH]
U8  STM32F407VGT6-2  [LQFP100]  (parts A,B,C of 3)
Y3  ABLS-8.000MHZ-B2-T  [FP-ABLS-MFG]

### Nets
+3V3: C53.1 C54.1 C55.1 C56.1 C57.1 C58.1 C59.1 FB2.2 J4.1 J5.1 P2.1 R27.1 U8.11(VDD) U8.19(VDD) U8.28(VDD) U8.50(VDD) U8.75(VDD) U8.100(VDD)
GND: C49.2 C50.2 C51.2 C52.2 C53.2 C54.2 C55.2 C56.2 C57.2 C58.2 C59.2 C60.2 C61.2 C62.1 C63.1 C64.2 D8.1 D9.1 D10.1 J4.4 J5.4 P2.3 sw1.2 U8.10(VSS) U8.20(VSSA) U8.27(VSS) U8.74(VSS) U8.99(VSS)
boot: R28.1 U8.94(BOOT0)
FPGA_STM_CS: U8.33(PC4)
FPGA_STM_IRQ: U8.34(PC5)
FPGA_STM_MISO: U8.31(PA6)
FPGA_STM_MOSI: U8.32(PA7)
FPGA_STM_SCK: U8.30(PA5)
led_blue: R26.1 U8.51(PB12)
led_green: R25.1 U8.52(PB13)
led_red: R24.1 U8.53(PB14)
MCU_D_N: U8.70(PA11)
MCU_D_P: U8.71(PA12)
reset: C64.1 J5.5 R27.2 sw1.1 U8.14(NRST)
SWCLK: J5.3 U8.76(PA14)
SWDIO: J5.2 U8.72(PA13)
USART_LOG_RX: J4.3 U8.26(PA3)
USART_LOG_TX: J4.2 U8.25(PA2)
VDDA: C49.1 C50.1 C51.1 C52.1 FB2.1 U8.21(VREF+) U8.22(VDDA)  [also labelled VREF]
NetC60_1: C60.1 U8.49(VCAP_1)
NetC61_1: C61.1 U8.73(VCAP_2)
NetC62_2: C62.2 U8.12(PH0) Y3.2
NetC63_2: C63.2 U8.13(PH1) Y3.1
NetD8_2: D8.2 R24.2
NetD9_2: D9.2 R25.2
NetD10_2: D10.2 R26.2
NetP2_2: P2.2 R28.2

Not connected (* = marked no-connect by the designer): U8 1(PE2) 2(PE3) 3(PE4) 4(PE5) 5(PE6) 6(VBAT) 7(PC13) 8(PC14) 9(PC15) 15(PC0) 16(PC1) 17(PC2) 18(PC3) 23(PA0) 24(PA1) 29(PA4) 35(PB0) 36(PB1) 37(PB2) 38(PE7) 39(PE8) 40(PE9) 41(PE10) 42(PE11) 43(PE12) 44(PE13) 45(PE14) 46(PE15) 47(PB10) 48(PB11) 54(PB15) 55(PD8) 56(PD9) 57(PD10) 58(PD11) 59(PD12) 60(PD13) 61(PD14) 62(PD15) 63(PC6) 64(PC7) 65(PC8) 66(PC9) 67(PA8) 68(PA9) 69(PA10)* 77(PA15) 78(PC10) 79(PC11) 80(PC12) 81(PD0) 82(PD1) 83(PD2) 84(PD3) 85(PD4) 86(PD5) 87(PD6) 88(PD7) 89(PB3) 90(PB4) 91(PB5) 92(PB6) 93(PB7) 95(PB8) 96(PB9) 97(PE0) 98(PE1)

### Notes on the sheet
- (near U8) 26uF değeri kontol edilecek
- OSC CAP KONTROL ET

### Library data of the parts
C49-C64 = CMP-1035-02072-1: CAP 2.7nF 16V ±20% 0603 (1608 Metric) Thickness 1mm SMD; Tolerance: Â±20%; Case-Metric: 1608; Case-EIA: 0603; Rated Voltage: 16 V; Technology: SMT; Value: 2.7nF; Max Thickness: 1 mm
D8-D10 = LED RED 0805: LED Uni-Color Hyper Red 660nm 2-Pin Chip 0805(2012Metric) T/R; Manufacturer: Osram Opto; Lens Color: White; Forward Voltage: 1.8V; Lens Style: Diffused,Flat,Colorless; Luminous Intensity: 71mcd; Viewing Angle: 160°; Forward Current: 30mA; Dominant Wavelength: 645nm; Number of Elements: 1; Test Current: 20mA; Reverse Voltage: 5V; Lens Transparency: Diffused; Luminous Flux: 0.17lm; Lens Size: 1.25mm; Designed by: BERK; Supplier 1: Digi-Key; Manufacturer Part Number: LH R974-LP-1; RoHS: Yes; Category: LEDs; Stock 1: 35632; Pricing 1: 1=0,26000, 10=0,13900, 100=0,06480, 500=0,05978, 1000=0,04683, 2000=0,04584 (USD); Mount: Surface Mount; Case/Package: 0805; Number of Pins: 2; Color: Red; Case Code (Imperial): 0805; Case Code (Metric): 2012; Min Operating Temperature: -30°C; Max Operating Temperature: 85°C; Packaging: Tape and Reel; Illumination Color: Red; Package Quantity: 1; Series: CHipLED; Length: 2.1mm; Width: 1.25mm; Depth: 1.35mm; Radiation Hardening: No; RoHS Compliant: Yes; ComponentLink1URL: http://www.jameco.com/Jameco/Products/ProdDS/2085634.pdf?src-supplier=Jameco; ComponentLink1Description: http://www.jameco.com/Jameco/Products/ProdDS/2085634.pdf?src-supplier=Jameco; ComponentLink2URL: http://components.arrow.com/part/dataview/0323_01825492?src-supplier=Arrow+Europe; ComponentLink2Description: http://components.arrow.com/part/dataview/0323_01825492?src-supplier=Arrow+Europe; ComponentLink3URL: https://dammedia.osram.info/media/resource/hires/osram-dam-2493888/LH%20R974.pdf?src-supplier=Digi-Key; ComponentLink3Description: https://dammedia.osram.info/media/resource/hires/osram-dam-2493888/LH%20R974.pdf?src-supplier=Digi-Key; ComponentLink4URL: http://www.mouser.com/ds/2/311/LH%20R974%20-%20CHIPLED%200805-318659.pdf?src-supplier=Mouser; ComponentLink4Description: http://www.mouser.com/ds/2/311/LH%20R974%20-%20CHIPLED%200805-318659.pdf?src-supplier=Mouser; ComponentLink5URL: https://www.verical.com/server-webapp/html/getDatasheet?partID=258950&src-supplier=Verical; ComponentLink5Description: https://www.verical.com/server-webapp/html/getDatasheet?partID=258950&src-supplier=Verical; ComponentLink6URL: http://components.arrow.com/part/dataview/41971690S1077610N9133?src-supplier=Arrow+Electronics; ComponentLink6Description: http://components.arrow.com/part/dataview/41971690S1077610N9133?src-supplier=Arrow+Electronics; ComponentLink7URL: http://components.arrow.com/part/dataview/41971690S6190115N2128?src-supplier=Arrow+Electronics; ComponentLink7Description: http://components.arrow.com/part/dataview/41971690S6190115N2128?src-supplier=Arrow+Electronics; Supplier Part Number 1: 475-1415-1-ND
FB2 = CMP-0686-00575-3: Chip Ferrite Bead, 0603, 60Ω @ 100MHz, 0.1Ω, , 1A; ESR (Equivalent Series Resistance): 60R; Number of Lines: 1; Material: Steel; Tolerance: 25%; Shielding: Unshielded; Current Rating: 500mA; Resistance: 100mR; Package Quantity: 1; Termination: SMD/SMT; Lead Free: Lead Free; Max Operating Temperature: 125°C; Number of Circuits: 1; Length: 1.6mm; Min Operating Temperature: -55°C; Case Code (Metric): 1608; Max DC Current: 500mA; REACH SVHC: No SVHC; Frequency: 100MHz; Number of Pins: 2; RoHS Compliant: Yes; Height: 0.8mm; Depth: 0.8mm; Width: 0.8mm; Test Frequency: 100MHz; Case/Package: 0603; Impedance: 60R; Max Current Rating: 500mA; Packaging: Tape and Reel; DC Resistance (DCR): 100mR; Case Code (Imperial): 0603; Core Material: Ferrite
J4 = B4B-PH-K-S(LF)(SN): Connector Header Through Hole 4 position 0.079 (2.00mm); MF: JST Sales; SnapEDA_Link: https://www.snapeda.com/parts/B4B-PH-K-S%20(LF)(SN)/JST/view-part/?ref=snap; Package: None; Value: *; MP: B4B-PH-K-S (LF)(SN); Check_prices: https://www.snapeda.com/parts/B4B-PH-K-S%20(LF)(SN)/JST/view-part/?ref=eda
J5 = B5B-PH-K-S(LF)(SN): Conn Shrouded Header (4 Sides) HDR 5 POS 2mm Solder ST Top Entry Thru-Hole Box; MF: JST Sales America Inc.; SnapEDA_Link: https://www.snapeda.com/parts/B5B-PH-K-S(LF)(SN)/JST/view-part/?ref=snap; Package: None; Value: *; MP: B5B-PH-K-S(LF)(SN); Check_prices: https://www.snapeda.com/parts/B5B-PH-K-S(LF)(SN)/JST/view-part/?ref=eda
P2 = Header 3: Header, 3-Pin; ASiD Part Number: Header 3-AS
R24-R28 = CMP-2002-01682-1: as R31 on sheet Sheet1
sw1 = Tac switch: small tac switch; ASiD Part Number: Tac switch-AS
Y3 = CMP-27762-009874-1: CRYSTAL 8.0000MHZ 18PF SMD; ESR (Equivalent Series Resistance): 80R; Operating Frequency: 8 MHz; Frequency Stability: 50ppm; Tolerance: 20ppm; Frequency: 8MHz; Min Operating Temperature: -20°C; Lead Free: Lead Free; Width: 4.7mm; Packaging: Tape and Reel; Series: ABLS; Accuracy: 20ppm; Length: 11.4mm; Frequency Tolerance: 20ppm; Termination: SMD/SMT; Number of Pins: 2; Radiation Hardening: No; Depth: 4.7mm; REACH SVHC: No SVHC; Contact Plating: Tin; Load Capacitance: 18pF; Case/Package: SMD/SMT; Mount: Surface Mount; Package Quantity: 1000; Max Operating Temperature: 70°C; Height: 0.165inch; Series Resistance: 80R

## Sheet Sheet6.SchDoc
size A3; SheetNumber: 6; SheetTotal: 6
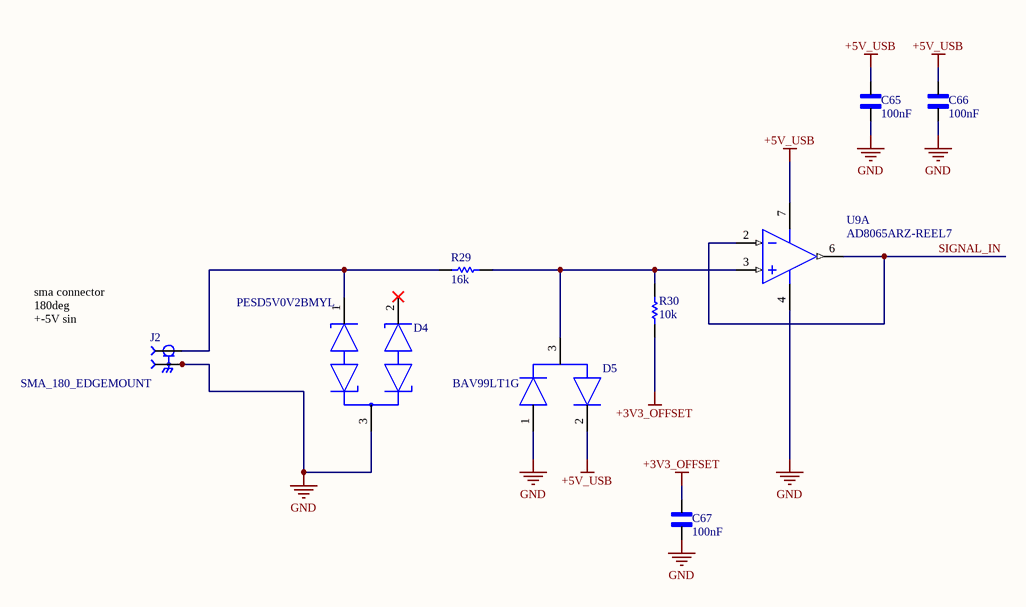
[diagram p5: Sheet6.SchDoc]

### Parts
C65  Parameter 1: 100nF  [0402]  (hidden comment: CC0402JRX7R7BB104)
C66  Parameter 1: 100nF  [0402]  (hidden comment: CC0402JRX7R7BB104)
C67  Parameter 1: 100nF  [0402]  (hidden comment: CC0402JRX7R7BB104)
D4  PESD5V0V2BMYL  [FP-SOT883-MFG]
D5  BAV99LT1G  [FP-318-08-IPC_B]
J2  SMA_180_EDGEMOUNT  [SMA]
R29  16k  [RESC1005X40X20NL05T10]
R30  10k  [RESC1005X40X20NL05T10]
U9  AD8065ARZ-REEL7  [SOIC-8]  (part A of 2)

### Nets
+3V3_OFFSET: C67.2 R30.2
+5V_USB: C65.2 C66.2 D5.2(C) U9.7(+VS)
GND: C65.1 C66.1 C67.1 D4.3(COMMON_CATHODE) D5.1(A) J2.G1 J2.G2 J2.G3 J2.G4 U9.4(-VS)
SIGNAL_IN: U9.2(-IN) U9.6(VOUT)
NetD4_1: D4.1(1_CATHODE) J2.1 R29.2
NetD5_3: D5.3(CATHODE/ANODE) R29.1 R30.1 U9.3(+IN)

Not connected (* = marked no-connect by the designer): D4 2(2_CATHODE)*

### Notes on the sheet
- (near J2) sma connector 180deg
  +-5V sin

### Library data of the parts
C65-C67 = CAP_CER_0402: CAP CER 0.1UF 16V X7R 0402
D4 = CMP-14436-000012-1: TVS DIODE 5V 12.5V DFN1006-3
D5 = CMP-07163-000036-1: DIODE ARRAY 100V 215MA SOT23-3; Capacitance: 1.5pF; Current Rating: 200mA; Max Repetitive Reverse Voltage (Vrrm): 70V; Forward Voltage: 1.25V; Max Forward Surge Current (Ifsm): 500mA; Peak Reverse Current: 2.5uA; Forward Current: 150mA; Peak Non-Repetitive Surge Current: 2A; Reverse Recovery Time: 6ns; Length: 2.9mm; Voltage Rating (DC): 70V; Case/Package: SOT-23; Height: 0.94mm; Number of Pins: 3; Mount: Surface Mount; Min Operating Temperature: -65°C; Lead Free: Lead Free; REACH SVHC: No SVHC; Width: 1.3mm; Packaging: Tape and Reel; Max Operating Temperature: 150°C
R29 R30 = CMP-2002-01682-1: as R31 on sheet Sheet1
U9 = ADI-AD8XX-X8: Single Channel Low Power Operational Amplifier, 145 MHz BW, 180 V/us SR, Industrial, 8-pin SOIC (R-8), Reel; Manufacturer: Analog Devices; Generic Part Number: AD8065; V Span Max: 24V; Input Bias Current: 2pA; V Span Min: 5V; Small Signal Bandwidth: 145MHz; Input Offset Voltage: 400uV; Iq/Amp: 7.4mA; Amplifiers Per Package: 1; Automotive Qualified: Yes; PartNumber: AD8065ARZ-REEL7; ComponentLink1URL: http://www.analog.com/en/index.html; PackageVersion: 060506-A; DatasheetVersion: Rev. J; ComponentLink4URL: http://www.analog.com/en/all-operational-amplifiers-op-amps/operational-amplifiers-op-amps/ad8065/products/product.html#product-recommendations; ComponentLink2URL: http://www.analog.com/static/imported-files/data_sheets/AD8065_8066.pdf; PackageDescription: 8-Pin Standard Small Outline Package, Body 3.9 x 4.9 mm, Pitch 1.27 mm; ComponentLink2Description: Datasheet; ComponentLink1Description: Manufacturer URL; Mounting Technology: Surface Mount; PackageReference: R-8; ComponentLink3Description: Package Specification; Slew Rate: 180V/us; RevisionNote: Reference Circuit URL fixed; ComponentLink4Description: Reference Circuit; Code_JEDEC: MS-012-AA; ComponentLink3URL: http://www.analog.com/static/imported-files/packages/PKG_PDF/SOIC_Narrow%20(R)/R_8.pdf

## Nets that join several sheets
+1V0: Sheet1 (C6.2 R35.2 U2.3 U5.1), Sheet2 (22 pins)
+1V8: Sheet1 (C7.2 R34.2 U1.3 U2.5), Sheet2 (9 pins)
+3V3: Sheet1 (C9.2 R33.2 U1.5), Sheet2 (15 pins), Sheet3 (9 pins), Sheet4 (7 pins), Sheet5 (18 pins)
+3V3_OFFSET: Sheet1 (C11.2 R32.2 U4.5), Sheet6 (C67.2 R30.2)
+5V_ANALOG: Sheet1 (C3.2 C4.2 FB1.2), Sheet4 (5 pins)
+5V_USB: Sheet1 (16 pins), Sheet6 (C65.2 C66.2 D5.2 U9.7)
GND: Sheet1 (31 pins), Sheet2 (71 pins), Sheet3 (6 pins), Sheet4 (18 pins), Sheet5 (28 pins), Sheet6 (10 pins)
FLASH_CLK: Sheet3 (R6.1 U7.6), Sheet4 (U6.A8)
FLASH_CS: Sheet3 (R5.1 U7.1), Sheet4 (U6.C11 U6.E13)
FLASH_HOLD: Sheet3 (R3.1 U7.7), Sheet4 (U6.C10)
FLASH_MISO: Sheet3 (U7.2), Sheet4 (U6.B12)
FLASH_MOSI: Sheet3 (U7.5), Sheet4 (U6.B11)
FLASH_WP: Sheet3 (R4.1 U7.3), Sheet4 (U6.D10)
FPGA_STM_CS: Sheet4 (U6.G14), Sheet5 (U8.33)
FPGA_STM_IRQ: Sheet4 (U6.J14), Sheet5 (U8.34)
FPGA_STM_MISO: Sheet4 (U6.B14), Sheet5 (U8.31)
FPGA_STM_MOSI: Sheet4 (U6.F14), Sheet5 (U8.32)
FPGA_STM_SCK: Sheet4 (U6.A13), Sheet5 (U8.30)
JTAG_TCK: Sheet3 (J3.3), Sheet4 (U6.A7)
JTAG_TDI: Sheet3 (J3.5), Sheet4 (U6.P7)
JTAG_TDO: Sheet3 (J3.4), Sheet4 (U6.P6)
JTAG_TMS: Sheet3 (J3.6), Sheet4 (U6.M6)
MCU_D_N: Sheet1 (U3.6), Sheet5 (U8.70)
MCU_D_P: Sheet1 (U3.4), Sheet5 (U8.71)
SIGNAL_IN: Sheet4 (R20.2), Sheet6 (U9.2 U9.6)